# Altium schematic sheet Hdr1.SchDoc
size Letter; SheetNumber: 8; SheetTotal: 15
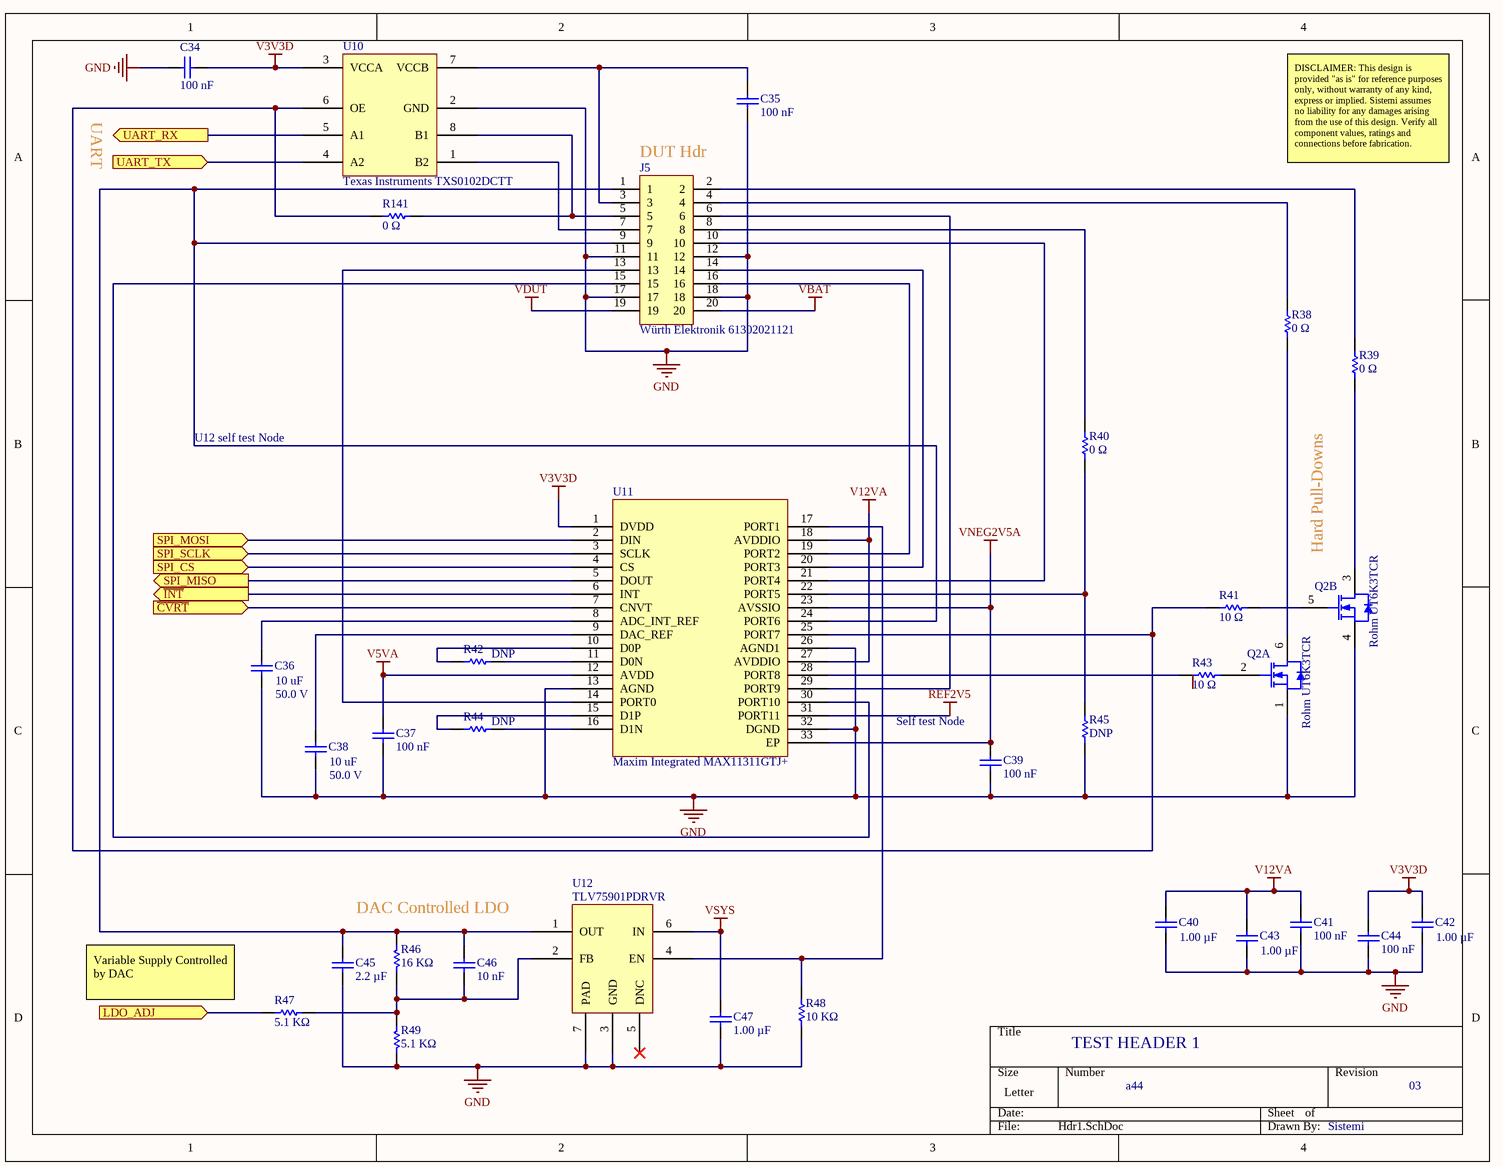
[diagram p0: Hdr1.SchDoc]

## Parts
C34  Capacitance: 100 nF  [CAPC1005X56X25NL10T15]  (hidden comment: Samsung CL05B104KO5NNNC)
C35  Capacitance: 100 nF  [CAPC1005X56X25NL10T15]  (hidden comment: Samsung CL05B104KO5NNNC)
C36  Capacitance: 10 uF  Voltage Rating (DC): 50.0 V  [CAPC3216X180X55LL20T25]  (hidden comment: Murata GRM31CR61H106KA12L)
C37  Capacitance: 100 nF  [CAPC1005X56X25NL10T15]  (hidden comment: Samsung CL05B104KO5NNNC)
C38  Capacitance: 10 uF  Voltage Rating (DC): 50.0 V  [CAPC3216X180X55LL20T25]  (hidden comment: Murata GRM31CR61H106KA12L)
C39  Capacitance: 100 nF  [CAPC1005X56X25NL10T15]  (hidden comment: Samsung CL05B104KO5NNNC)
C40  Capacitance: 1.00 µF  [CAPC1608X90X35NL15T15]  (hidden comment: Samsung CL10B105KA8NNNC)
C41  Capacitance: 100 nF  [CAPC1005X56X25NL10T15]  (hidden comment: Samsung CL05B104KO5NNNC)
C42  Capacitance: 1.00 µF  [CAPC1608X90X35NL15T15]  (hidden comment: Samsung CL10B105KA8NNNC)
C43  Capacitance: 1.00 µF  [CAPC1608X90X35NL15T15]  (hidden comment: Samsung CL10B105KA8NNNC)
C44  Capacitance: 100 nF  [CAPC1005X56X25NL10T15]  (hidden comment: Samsung CL05B104KO5NNNC)
C45  Capacitance: 2.2 µF  [CAPC1608X90X35NL15T15]  (hidden comment: 2.2 µF,±10%,25V,X7R,0603)
C46  Capacitance: 10 nF  [CAPC1005X56X25NL10T15]  (hidden comment: 10 nF,±10%,25V,CGO,0402)
C47  Capacitance: 1.00 µF  [CAPC1608X90X35NL15T15]  (hidden comment: Samsung CL10B105KA8NNNC)
J5  Würth Elektronik 61302021121  [PCB-nk6cd1c3p7lqby8wsdwb-1]
Q2  Rohm UT6K3TCR  [DFN2020-8D]  (parts A,B of 2)
R38  Resistance: 0 Ω  [RESC1608X55X30ML15T15]  (hidden comment: Generic RES 0603)
R39  Resistance: 0 Ω  [RESC1608X55X30ML15T15]  (hidden comment: Generic RES 0603)
R40  Resistance: 0 Ω  [RESC1608X55X30ML15T15]  (hidden comment: Generic RES 0603)
R41  Resistance: 10 Ω  [RESC1005X40X25NL05T05]  (hidden comment: 10 Ω,±1%,0402)
R42  Resistance: DNP  [RESC1608X55X30ML15T15]  (hidden comment: Generic RES 0603)
R43  Resistance: 10 Ω  [RESC1005X40X25NL05T05]  (hidden comment: 10 Ω,±1%,0402)
R44  Resistance: DNP  [RESC1608X55X30ML15T15]  (hidden comment: Generic RES 0603)
R45  Resistance: DNP  [RESC1608X55X30ML15T15]  (hidden comment: Generic RES 0603)
R46  Resistance: 16 KΩ  [RESC1608X55X30ML15T15]  (hidden comment: Generic RES 0603)
R47  Resistance: 5.1 KΩ  [RESC1608X55X30ML15T15]  (hidden comment: Generic RES 0603)
R48  Resistance: 10 KΩ  [RESC1608X55X30ML15T15]  (hidden comment: Generic RES 0603)
R49  Resistance: 5.1 KΩ  [RESC1608X55X30ML15T15]  (hidden comment: Generic RES 0603)
R141  Resistance: 0 Ω  [RESC1608X55X30ML15T15]  (hidden comment: Generic RES 0603)
U10  Texas Instruments TXS0102DCTT  [PCB-19361507-1]
U11  Maxim Integrated MAX11311GTJ+  [PCB-s1hzzxkmij8s4b201del-1]
U12  TLV75901PDRVR  [PCB-ude52gq66msu1251nhm5-1]

## Ports
LDO_ADJ (in), SPI_CS (in), SPI_MISO (out), SPI_MOSI (in), SPI_SCLK (in), UART_RX (out), UART_TX (in), ~{CVRT} (in), ~{INT} (out)

## Nets
3: Q2.8(D)
6: Q2.7(D)
GND: C34.1 C35.2 C36.1 C37.2 C38.1 C39.2 C40.1 C41.2 C42.1 C43.1 C44.2 C45.1 C47.1 J5.11 J5.12 J5.17 J5.18 Q2.1(S) Q2.4(S) R45.1 R48.1 R49.1 U10.2(GND) U11.13(AGND) U11.26(AGND1) U11.32(DGND) U12.3(GND) U12.7(PAD)
REF2V5: U11.31(PORT11)
V3V3D: C34.2 C42.2 C44.1 U10.3(VCCA) U11.1(DVDD)
V5VA: C37.1 U11.12(AVDD)
V12VA: C40.2 C41.1 C43.2 U11.18(AVDDIO) U11.27(AVDDIO)
VBAT: J5.20
VDUT: J5.19
VNEG2V5A: C39.1 U11.23(AVSSIO) U11.33(EP)
VSYS: C47.2 U12.6(IN)
~{CVRT}: U11.7(CNVT) ; port ~{CVRT}
~{INT}: U11.6(INT) ; port ~{INT}
LDO_ADJ: R47.2 ; port LDO_ADJ
SPI_CS: U11.4(CS) ; port SPI_CS
SPI_MISO: U11.5(DOUT) ; port SPI_MISO
SPI_MOSI: U11.2(DIN) ; port SPI_MOSI
SPI_SCLK: U11.3(SCLK) ; port SPI_SCLK
UART_RX: U10.5(A1) ; port UART_RX
UART_TX: U10.4(A2) ; port UART_TX
NetC35_1: C35.1 J5.3 U10.7(VCCB)
NetC36_2: C36.2 U11.8(ADC_INT_REF)
NetC38_2: C38.2 U11.9(DAC_REF)
NetC45_2: C45.2 C46.2 J5.1 J5.9 R46.2 U11.24(PORT6) U12.1(OUT)
NetC46_1: C46.1 R46.1 R47.1 R49.2 U12.2(FB)
NetJ5_2: J5.2 R39.2
NetJ5_4: J5.4 R38.2
NetJ5_5: J5.5 R141.1 U10.8(B1)
NetJ5_6: J5.6 U11.29(PORT9)
NetJ5_7: J5.7 U10.1(B2)
NetJ5_8: J5.8 R40.2
NetJ5_10: J5.10 U11.21(PORT4)
NetJ5_13: J5.13 U11.14(PORT0)
NetJ5_14: J5.14 U11.20(PORT3)
NetJ5_15: J5.15 U11.30(PORT10)
NetJ5_16: J5.16 U11.19(PORT2)
NetQ2_2: Q2.2(G) R43.1
NetQ2_3: Q2.3(D) R39.1
NetQ2_5: Q2.5(G) R41.1
NetQ2_6: Q2.6(D) R38.1
NetR40_1: R40.1 R45.2 U11.22(PORT5)
NetR41_2: R41.2 R141.2 U10.6(OE) U11.25(PORT7)
NetR42_1: R42.1 U11.11(D0N)
NetR42_2: R42.2 U11.10(D0P)
NetR43_2: R43.2 U11.28(PORT8)
NetR44_1: R44.1 U11.16(D1N)
NetR44_2: R44.2 U11.15(D1P)
NetR48_2: R48.2 U11.17(PORT1) U12.4(EN)

Not connected (* = marked no-connect by the designer): U12 5(DNC)*

## Notes on the sheet
- UART
- (near J5) DUT Hdr
- DISCLAIMER: This design is provided "as is" for reference purposes only, without warranty of any kind, express or implied. Sistemi assumes no liability for any damages arising from the use of this design. Verify all component values, ratings and connections before fabrication.
- U12 self test Node
- Hard Pull-Downs
- (near C39) Self test Node
- DAC Controlled LDO
- (near R47) Variable Supply Controlled
  by DAC
- TEST HEADER 1
- a44
- 03
- Sistemi

## Library data of the parts
C34 C35 C37 C39 C41 C44 = CMP-bf2276a55d9a60e5-19: Ceramic capacitor SMD-0402 100nF /16V X7R# K +-10%, Samsung, RoHS; Dielectric Characteristic: X7R; Lead-Free Status: Lead Free; Voltage Rating (DC): 16.0 V; Capacitance Tolerance: ±10%; Mounting Style: Surface Mount; Case/Package: 0402; OctopartID: 0755ced2c795d892; Footprint: PCB-0002-00476-3; Octopart URL: https://octopart.com/cl05b104ko5nnnc-samsung-9299366; RoHS: Compliant; Manufacturer Part Number: CL05B104KO5NNNC
C36 C38 = CMP-3554908-2: Multilayer Ceramic Capacitors MLCC - SMD/SMT 1206 10uF 50volt X5R +/-10%; Manufacturer Part Number: CL31B106KBHNNNE; Capacitance Tolerance: ±10%; Case/Package (SI): 3216; Lead-Free Status: Lead Free; Dielectric Characteristic: X5R; Lifecycle Status: Active; Mounting Style: Surface Mount; Number of Pins: 2; Octopart Url: https://octopart.com/grm31cr61h106ka12l-murata-18903335; OctopartID: fd8535afa9c42242; Packaging: Cut Tape (CT); REACH SVHC Compliance: No SVHC; RoHS: Compliant; Size-Length: 0.0032 m; Size-Thickness: 0.0016 m; Size-Width: 0.0016 m
C40 C42 C43 C47 = CMP-7473528-5: CL Series 0603 1 uF 25 V ±10 % X7R Surface Mount Multilayer Ceramic Capacitor; Manufacturer Part Number: UMK107AB7105KA-T; Lead-Free Status: Lead Free; Capacitance Tolerance: ±10%; Voltage Rating (DC): 25.0 V; RoHS: Compliant; Mounting Style: Surface Mount; Footprint: PCB-0002-00062-3; Octopart URL: http://octopart.com/cl10b105ka8nnnc-samsung-19831597; Case/Package: 0603; OctopartID: ce7a065e703111bd; Dielectric Characteristic: X7R
C45 = CMP-7473528-7: Generic CAP 0603, =Capacitance+','+Tolerance+','+Voltage+','+Dielectric; Manufacturer Part Number: GRM188Z71E225KE43D; Lead-Free Status: Lead Free; RoHS: Compliant; Voltage: 25V; Footprint: PCB-0002-00062-3; Dielectric: X7R; Tolerance: ±10%; OctopartID: ce7a065e703111bd; Mounting Style: Surface Mount; Octopart URL: TBD; Case: 0603
C46 = CMP-bf2276a55d9a60e5-20: Generic CAP 0402, =Capacitance+','+Tolerance+','+Voltage+','+Dielectric+','+Case; Manufacturer Part Number: GRM1555C1E103JE01J; Lead-Free Status: Lead Free; Octopart URL: TBD; Case: 0402; OctopartID: 0755ced2c795d892; Voltage: 25V; Dielectric: CGO; RoHS: Compliant; Mounting Style: Surface Mount; Tolerance: ±10%; Footprint: PCB-0002-00476-3
J5 = CMP-005cc8a3733edf9b-7: THT Vertical Pin Header WR-PHD, Pitch 2.54 mm, Dual Row, 20 pins; Current Rating: 3.00 A; Dielectric Withstanding Voltage: 500 V; Pin Pitch: 2.54 mm; Operating Voltage: 250 V; Number of Contacts: 20; Contact Resistance: 20.0 mΩ; Gender: Male; Contact Material: Copper; Footprint: PCB-005cc8a3733edf9b-1; Mounting Style: Through Hole; Color: Black; Contact Plating: Gold; REACH SVHC Compliance: No SVHC; RoHS: Compliant; Octopart URL: https://octopart.com/61302021121-w%C3%BCrth+elektronik-32855556; Packaging: Bag; Orientation: Vertical; OctopartID: 005cc8a3733edf9b; Number of Pins: 20; Operating Temperature: -40.0 °C (min); Manufacturer Part Number: 61302021121
Q2 = CMP-7da2b0d499b7a265-2: On a Reel of 3000, Dual N-Channel MOSFET, 5.5 A, 30 V, 8-Pin DFN ROHM UT6K3TCR; Polarity: Dual N-Channel; Footprint: PCB-qj1nrqbgj5udp5r3frdj-1; RoHS: Compliant; OctopartID: 7da2b0d499b7a265; Manufacturer Part Number: UT6K3TCR; Operating Temperature: 150 °C (max); Octopart URL: https://octopart.com/ut6k3tcr-rohm-75284851
R38-R40 R141 = CMP-0800c38b3cf2d7c7-3: Generic RES 0603, =Resistance+','+Tolerance+','+Case; Manufacturer Part Number: CRCW06030000Z0EAC; Case/Package (SI): 1608; Lead-Free Status: Lead Free; Power Rating: 63.0 mW; Voltage: 50V; ELV Compliant: Compliant; Tolerance: ±1%; Temperature Coefficient: -50.0 ppm/°C to 50.0 ppm/°C; Octopart URL: TBD; Number of Pins: 2; Mounting Style: Surface Mount; Packaging: Tape & Reel (TR); Lifecycle Status: Active; RoHS: Compliant; Case: 0603; Operating Temperature: -55.0 °C to 125 °C; REACH SVHC Compliance: No SVHC; Footprint: PCB-0002-00066-3; OctopartID: a8e96364fc37772e
R41 R43 = CMP-3902036-3: Generic RES 0402, =Resistance+','+Tolerance+','+Case; Manufacturer Part Number: RT0402FRE0710RL; Lead-Free Status: Lead Free; Voltage: 50.0 V; Power: 0.063 W; Mounting Style: Surface Mount; RoHS: Compliant; Number of Pins: 2; Tolerance: ±1%; Octopart Url: TBD; Case: 0402; OctopartID: 26dced8948c2f91b
R42 R44 R45 = CMP-0800c38b3cf2d7c7-3: Generic RES 0603, =Resistance+','+Tolerance+','+Case; Manufacturer Part Number: TBD; Case/Package (SI): 1608; Lead-Free Status: Lead Free; Power Rating: 63.0 mW; Voltage: 50V; ELV Compliant: Compliant; Tolerance: ±1%; Temperature Coefficient: -50.0 ppm/°C to 50.0 ppm/°C; Octopart URL: TBD; Number of Pins: 2; Mounting Style: Surface Mount; Packaging: Tape & Reel (TR); Lifecycle Status: Active; RoHS: Compliant; Case: 0603; Operating Temperature: -55.0 °C to 125 °C; REACH SVHC Compliance: No SVHC; Footprint: PCB-0002-00066-3; OctopartID: a8e96364fc37772e
R46 = CMP-0800c38b3cf2d7c7-3: Generic RES 0603, =Resistance+','+Tolerance+','+Case; Manufacturer Part Number: MCT06030C1602FP500; Case/Package (SI): 1608; Lead-Free Status: Lead Free; Power Rating: 63.0 mW; Voltage: 50V; ELV Compliant: Compliant; Tolerance: ±1%; Temperature Coefficient: -50.0 ppm/°C to 50.0 ppm/°C; Octopart URL: TBD; Number of Pins: 2; Mounting Style: Surface Mount; Packaging: Tape & Reel (TR); Lifecycle Status: Active; RoHS: Compliant; Case: 0603; Operating Temperature: -55.0 °C to 125 °C; REACH SVHC Compliance: No SVHC; Footprint: PCB-0002-00066-3; OctopartID: a8e96364fc37772e
R47 R49 = CMP-0800c38b3cf2d7c7-3: Generic RES 0603, =Resistance+','+Tolerance+','+Case; Manufacturer Part Number: RT0603FRE075K1L; Case/Package (SI): 1608; Lead-Free Status: Lead Free; Power Rating: 63.0 mW; Voltage: 50V; ELV Compliant: Compliant; Tolerance: ±1%; Temperature Coefficient: -50.0 ppm/°C to 50.0 ppm/°C; Octopart URL: TBD; Number of Pins: 2; Mounting Style: Surface Mount; Packaging: Tape & Reel (TR); Lifecycle Status: Active; RoHS: Compliant; Case: 0603; Operating Temperature: -55.0 °C to 125 °C; REACH SVHC Compliance: No SVHC; Footprint: PCB-0002-00066-3; OctopartID: a8e96364fc37772e
R48 = CMP-0800c38b3cf2d7c7-3: Generic RES 0603, =Resistance+','+Tolerance+','+Case; Manufacturer Part Number: MCT06030C1002FP500; Case/Package (SI): 1608; Lead-Free Status: Lead Free; Power Rating: 63.0 mW; Voltage: 50V; ELV Compliant: Compliant; Tolerance: ±1%; Temperature Coefficient: -50.0 ppm/°C to 50.0 ppm/°C; Octopart URL: TBD; Number of Pins: 2; Mounting Style: Surface Mount; Packaging: Tape & Reel (TR); Lifecycle Status: Active; RoHS: Compliant; Case: 0603; Operating Temperature: -55.0 °C to 125 °C; REACH SVHC Compliance: No SVHC; Footprint: PCB-0002-00066-3; OctopartID: a8e96364fc37772e
U10 = CMP-19361507-3: Voltage Level Translator 2-CH Bidirectional 8-Pin SSOP T/R; Number of Bits: 2; Output Current: 1.00 mA; Supply Voltage (DC): 3.60 V (max), 1.65 V (min); Lead-Free Status: Lead Free; Octopart URL: https://octopart.com/txs0102dctt-texas+instruments-7512181; Lifecycle Status: Active; Operating Temperature: -40.0 °C to 85.0 °C; Packaging: Cut Tape (CT), Tape & Reel (TR); OctopartID: bfd576ad3ac66012; RoHS: Compliant; REACH SVHC Compliance: No SVHC; Manufacturer Part Number: TXS0102DCTT; Case/Package: SSOP; Number of Pins: 8
U11 = CMP-2cd8e1e00624f31f-4: 12-channel 12-Bit ADC and 12-Bit DAC, Analog PIXI, 12-Port Programmable Mixed-Signal I/O; Channels: 12; Lead-Free Status: Lead Free; Sample Rate: 400 kHz; Range Options: 0 to 2.5V, ±5V, 0 to +10V, -10V; Supply Voltage (DC): 4.75 V (max), 5.25 V (min); Manufacturer Part Number: MAX11311GTJ+; Lifecycle Status: Not Listed by Manufacturer; Octopart URL: http://octopart.com/max11311gtj%2B-maxim+integrated-70389658; RoHS: Compliant; Number of Bits: 12; OctopartID: 2cd8e1e00624f31f; Package: TQFN-32; Resolution: 12-bit
U12 = CMP-2b7ce7b2db7ff4bb-4: LDO Regulator Pos 0.55V to 5.5V 1A 6-Pin WSON EP T/R; Dropout Voltage: 190 mV; Number of Regulated Outputs: 1; Output Capacitor Type: Ceramic; Quiescent Current: 25.0 µA; OctopartID: 2b7ce7b2db7ff4bb; Manufacturer Part Number: TLV75901PDRVR; Footprint: PCB-6kp9dl1mk9yrlugndkjx-1; RoHS: Compliant; Octopart URL: https://octopart.com/tlv75901pdrvr-texas+instruments-96785765; Number of Pins: 6; Lifecycle Status: Pre-Release; Case/Package: WSON; Operating Temperature: -40.0 °C to 125 °C